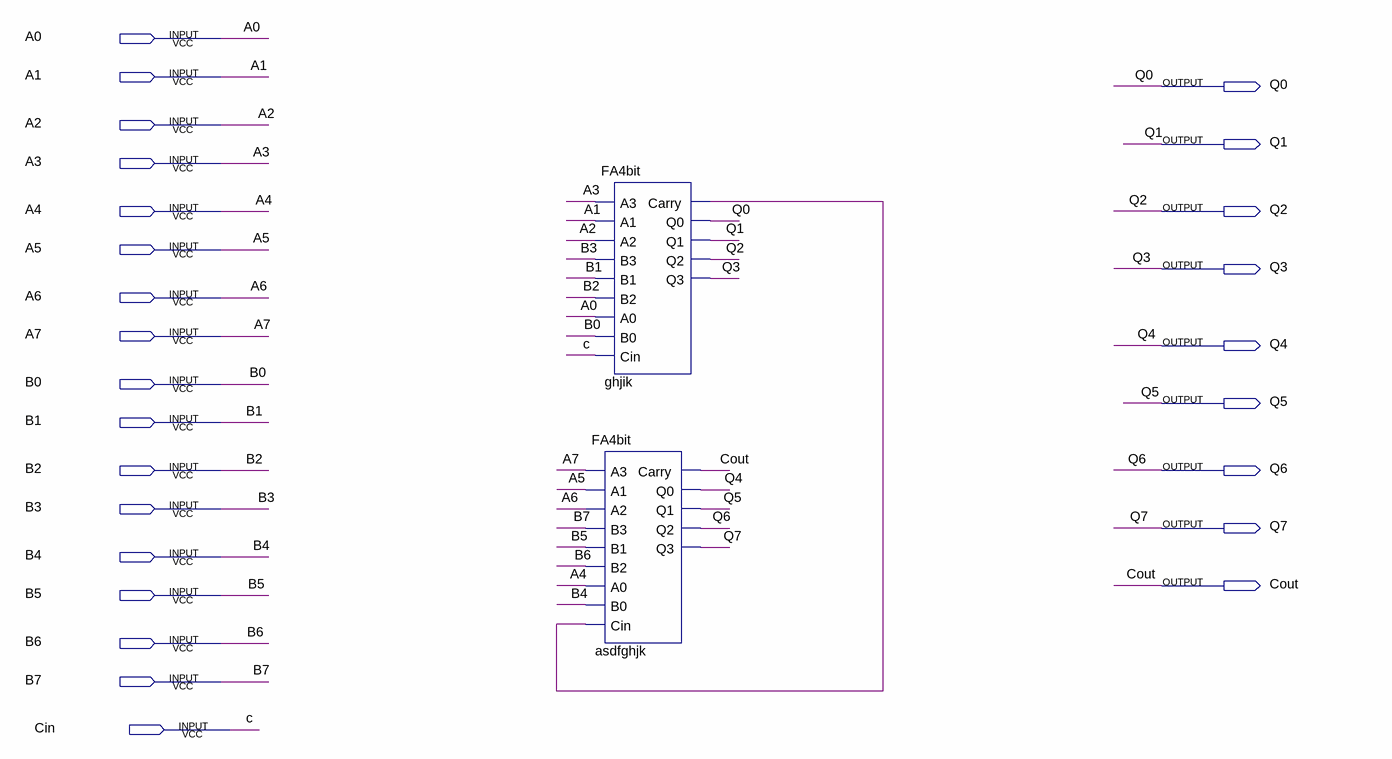
[diagram p0: schematic sheet]
// Quartus schematic FA8b.bdf as structural Verilog: 2 symbols, 26 pins
module FA8b (
  input  A0,
  input  A1,
  input  A2,
  input  A3,
  input  A4,
  input  A5,
  input  A6,
  input  A7,
  input  B0,
  input  B1,
  input  B2,
  input  B3,
  input  B4,
  input  B5,
  input  B6,
  input  B7,
  input  Cin,
  output Q0,
  output Q1,
  output Q2,
  output Q3,
  output Q4,
  output Q5,
  output Q6,
  output Q7,
  output Cout
);

  wire ghjik_carry;

  FA4bit ghjik (
    .A3(A3), .A1(A1), .A2(A2), .B3(B3), .B1(B1), .B2(B2), .A0(A0), .B0(B0), .Cin(Cin), .Carry(ghjik_carry),
    .Q0(Q0), .Q1(Q1), .Q2(Q2), .Q3(Q3));
  FA4bit asdfghjk (
    .A3(A7), .A1(A5), .A2(A6), .B3(B7), .B1(B5), .B2(B6), .A0(A4), .B0(B4), .Cin(ghjik_carry), .Carry(Cout),
    .Q0(Q4), .Q1(Q5), .Q2(Q6), .Q3(Q7));

  // Other names for the same wires on the sheet: c = Cin
endmodule
